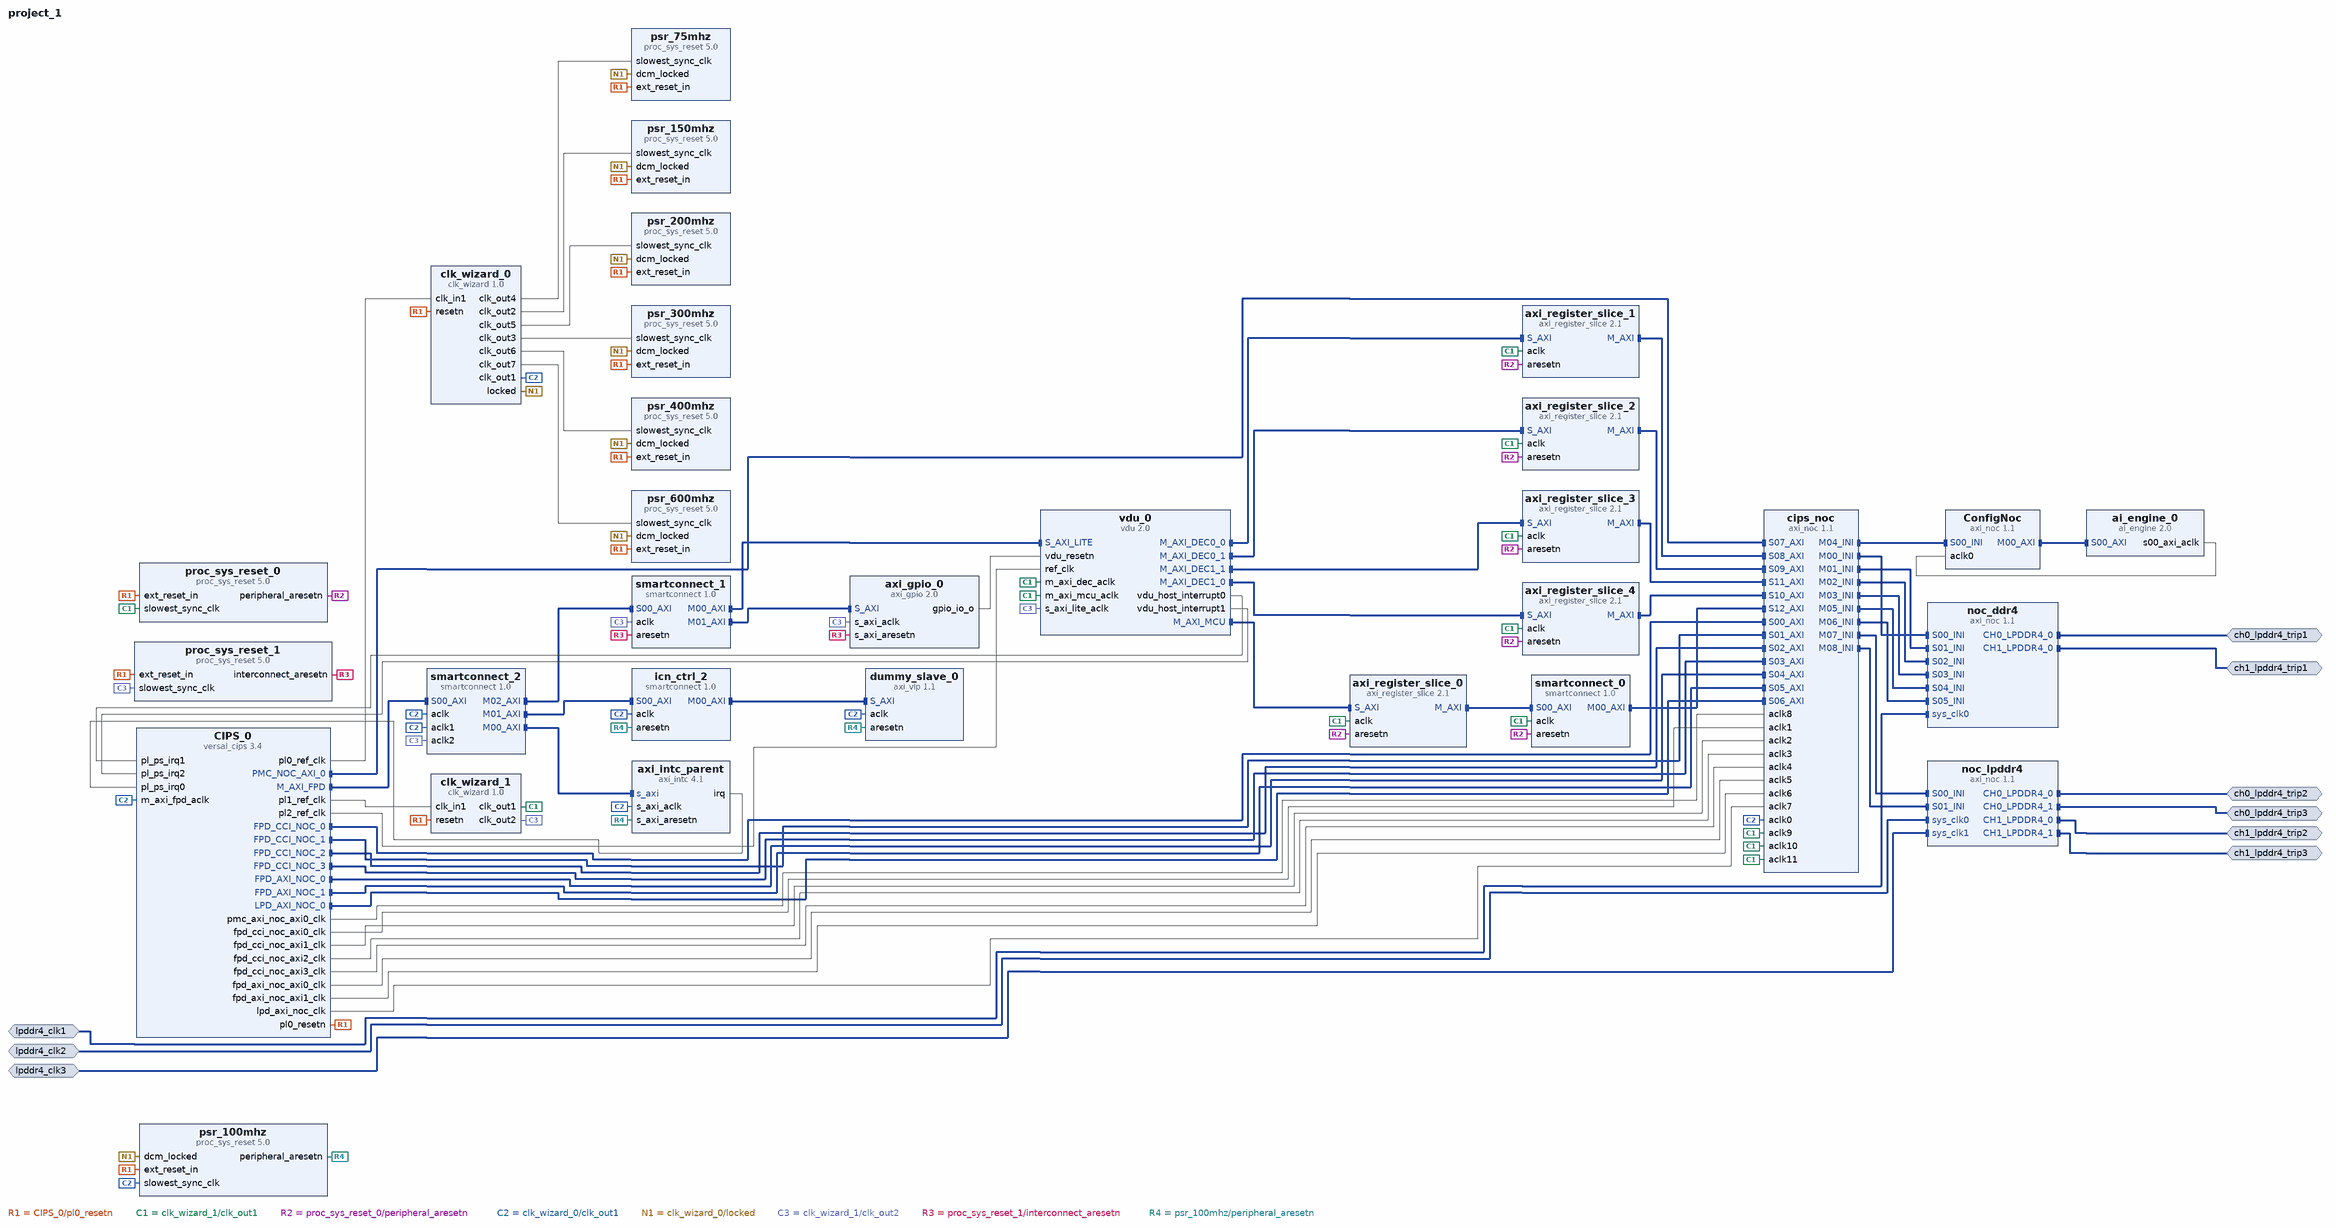
[diagram p0: block diagram of the top level]
# Vivado block design project_1, xcve2802-vsvh1760-2MP-e-S, Vivado 2025.2
create_bd_design project_1

create_bd_intf_port -mode Master -vlnv xilinx.com:interface:lpddr4_rtl:1.0 ch0_lpddr4_trip1
create_bd_intf_port -mode Master -vlnv xilinx.com:interface:lpddr4_rtl:1.0 ch0_lpddr4_trip2
create_bd_intf_port -mode Master -vlnv xilinx.com:interface:lpddr4_rtl:1.0 ch0_lpddr4_trip3
create_bd_intf_port -mode Master -vlnv xilinx.com:interface:lpddr4_rtl:1.0 ch1_lpddr4_trip1
create_bd_intf_port -mode Master -vlnv xilinx.com:interface:lpddr4_rtl:1.0 ch1_lpddr4_trip2
create_bd_intf_port -mode Master -vlnv xilinx.com:interface:lpddr4_rtl:1.0 ch1_lpddr4_trip3
create_bd_intf_port -mode Slave -vlnv xilinx.com:interface:diff_clock_rtl:1.0 lpddr4_clk1
set_property -dict {CONFIG.FREQ_HZ 200200200} [get_bd_intf_ports lpddr4_clk1]
create_bd_intf_port -mode Slave -vlnv xilinx.com:interface:diff_clock_rtl:1.0 lpddr4_clk2
set_property -dict {CONFIG.FREQ_HZ 200200200} [get_bd_intf_ports lpddr4_clk2]
create_bd_intf_port -mode Slave -vlnv xilinx.com:interface:diff_clock_rtl:1.0 lpddr4_clk3
set_property -dict {CONFIG.FREQ_HZ 200200200} [get_bd_intf_ports lpddr4_clk3]

create_bd_cell -type ip -vlnv xilinx.com:ip:versal_cips:3.4 CIPS_0
set_property -dict [list \
  CONFIG.DDR_MEMORY_MODE Custom \
  CONFIG.DEBUG_MODE JTAG \
  CONFIG.DESIGN_MODE 1 \
  CONFIG.DEVICE_INTEGRITY_MODE {Sysmon temperature voltage and external IO monitoring} \
  CONFIG.PS_BOARD_INTERFACE ps_pmc_fixed_io \
  CONFIG.PS_PL_CONNECTIVITY_MODE Custom \
  CONFIG.PS_PMC_CONFIG {['DDR_MEMORY_MODE {Connectivity to DDR via NOC}', 'DEBUG_MODE JTAG', 'DESIGN_MODE 1', 'DEVICE_INTEGRITY_MODE {Sysmon temperature voltage and external IO monitoring}', 'PMC_CRP_PL1_REF_CTRL_FREQMHZ 100', 'PMC_CRP_PL2_REF_CTRL_FREQMHZ 100', 'PMC_GPIO0_MIO_PERIPHERAL {{ENABLE 1} {IO {PMC_MIO 0 .. 25}}}', 'PMC_GPIO1_MIO_PERIPHERAL {{ENABLE 1} {IO {PMC_MIO 26 .. 51}}}', 'PMC_MIO12 {{AUX_IO 0} {DIRECTION out} {DRIVE_STRENGTH 8mA} {OUTPUT_DATA default} {PULL pullup} {SCHMITT 0} {SLEW slow} {USAGE GPIO}}', 'PMC_MIO37 {{AUX_IO 0} {DIRECTION out} {DRIVE_STRENGTH 8mA} {OUTPUT_DATA high} {PULL pullup} {SCHMITT 0} {SLEW slow} {USAGE GPIO}}', 'PMC_MIO38 {{AUX_IO 0} {DIRECTION out} {DRIVE_STRENGTH 8mA} {OUTPUT_DATA high} {PULL pullup} {SCHMITT 0} {SLEW slow} {USAGE GPIO}}', 'PMC_OSPI_PERIPHERAL {{ENABLE 1} {IO {PMC_MIO 0 .. 11}} {MODE Single}}', 'PMC_REF_CLK_FREQMHZ 33.3333', 'PMC_SD1 {{CD_ENABLE 1} {CD_IO {PMC_MIO 28}} {POW_ENABLE 1} {POW_IO {PMC_MIO 51}} {RESET_ENABLE 0} {RESET_IO {PMC_MIO 12}} {WP_ENABLE 0} {WP_IO {PMC_MIO 1}}}', 'PMC_SD1_PERIPHERAL {{CLK_100_SDR_OTAP_DLY 0x3} {CLK_200_SDR_OTAP_DLY 0x2} {CLK_50_DDR_ITAP_DLY 0x36} {CLK_50_DDR_OTAP_DLY 0x3} {CLK_50_SDR_ITAP_DLY 0x2C} {CLK_50_SDR_OTAP_DLY 0x4} {ENABLE 1} {IO {PMC_MIO 26 .. 36}}}', 'PMC_SD1_SLOT_TYPE {SD 3.0}', 'PMC_USE_PMC_NOC_AXI0 1', 'PS_BOARD_INTERFACE ps_pmc_fixed_io', 'PS_CAN0_PERIPHERAL {{ENABLE 1} {IO {PS_MIO 14 .. 15}}}', 'PS_CAN1_PERIPHERAL {{ENABLE 1} {IO {PS_MIO 16 .. 17}}}', 'PS_CRL_CAN0_REF_CTRL_FREQMHZ 160', 'PS_CRL_CAN1_REF_CTRL_FREQMHZ 160', 'PS_ENET0_MDIO {{ENABLE 1} {IO {PS_MIO 24 .. 25}}}', 'PS_ENET0_PERIPHERAL {{ENABLE 1} {IO {PS_MIO 0 .. 11}}}', 'PS_GEN_IPI0_ENABLE 1', 'PS_GEN_IPI0_MASTER A72', 'PS_GEN_IPI1_ENABLE 1', 'PS_GEN_IPI1_MASTER R5_0', 'PS_GEN_IPI2_ENABLE 1', 'PS_GEN_IPI2_MASTER R5_1', 'PS_GEN_IPI3_ENABLE 1', 'PS_GEN_IPI4_ENABLE 1', 'PS_GEN_IPI5_ENABLE 1', 'PS_GEN_IPI6_ENABLE 1', 'PS_GPIO_EMIO_PERIPHERAL_ENABLE 1', 'PS_GPIO_EMIO_WIDTH 1', 'PS_HSDP_EGRESS_TRAFFIC JTAG', 'PS_HSDP_INGRESS_TRAFFIC JTAG', 'PS_HSDP_MODE NONE', 'PS_I2C0_PERIPHERAL {{ENABLE 1} {IO {PMC_MIO 46 .. 47}}}', 'PS_I2C1_PERIPHERAL {{ENABLE 1} {IO {PMC_MIO 44 .. 45}}}', 'PS_I2CSYSMON_PERIPHERAL {{ENABLE 0} {IO {PMC_MIO 39 .. 40}}}', 'PS_IRQ_USAGE {{CH0 1} {CH1 1} {CH10 0} {CH11 0} {CH12 0} {CH13 0} {CH14 0} {CH15 0} {CH2 1} {CH3 0} {CH4 0} {CH5 0} {CH6 0} {CH7 0} {CH8 0} {CH9 0}}', 'PS_LPDMA0_ROUTE_THROUGH_FPD 1', 'PS_LPDMA1_ROUTE_THROUGH_FPD 1', 'PS_LPDMA2_ROUTE_THROUGH_FPD 1', 'PS_LPDMA3_ROUTE_THROUGH_FPD 1', 'PS_LPDMA4_ROUTE_THROUGH_FPD 1', 'PS_LPDMA5_ROUTE_THROUGH_FPD 1', 'PS_LPDMA6_ROUTE_THROUGH_FPD 1', 'PS_LPDMA7_ROUTE_THROUGH_FPD 1', 'PS_MIO7 {{AUX_IO 0} {DIRECTION in} {DRIVE_STRENGTH 8mA} {OUTPUT_DATA default} {PULL disable} {SCHMITT 0} {SLEW slow} {USAGE Reserved}}', 'PS_MIO9 {{AUX_IO 0} {DIRECTION in} {DRIVE_STRENGTH 8mA} {OUTPUT_DATA default} {PULL disable} {SCHMITT 0} {SLEW slow} {USAGE Reserved}}', 'PS_NUM_FABRIC_RESETS 1', 'PS_PCIE_EP_RESET1_IO {PS_MIO 18}', 'PS_PCIE_EP_RESET2_IO {PS_MIO 19}', 'PS_PCIE_RESET {ENABLE 1}', 'PS_PL_CONNECTIVITY_MODE Custom', 'PS_TTC0_PERIPHERAL_ENABLE 1', 'PS_TTC1_PERIPHERAL_ENABLE 1', 'PS_TTC2_PERIPHERAL_ENABLE 1', 'PS_TTC3_PERIPHERAL_ENABLE 1', 'PS_UART0_PERIPHERAL {{ENABLE 1} {IO {PMC_MIO 42 .. 43}}}', 'PS_USB3_PERIPHERAL {{ENABLE 1} {IO {PMC_MIO 13 .. 25}}}', 'PS_USE_FPD_AXI_NOC0 1', 'PS_USE_FPD_AXI_NOC1 1', 'PS_USE_FPD_CCI_NOC 1', 'PS_USE_M_AXI_FPD 1', 'PS_USE_M_AXI_LPD 0', 'PS_USE_NOC_LPD_AXI0 1', 'PS_USE_PMCPL_CLK0 1', 'PS_USE_PMCPL_CLK1 1', 'PS_USE_PMCPL_CLK2 1', 'PS_USE_PMCPL_CLK3 0', 'SMON_ALARMS Set_Alarms_On', 'SMON_ENABLE_TEMP_AVERAGING 0', 'SMON_INTERFACE_TO_USE I2C', 'SMON_MEAS24 {{ALARM_ENABLE 1} {ALARM_LOWER 0.00} {ALARM_UPPER 2.00} {AVERAGE_EN 0} {ENABLE 1} {MODE {2 V unipolar}} {NAME VCCAUX} {SUPPLY_NUM 0}}', 'SMON_MEAS25 {{ALARM_ENABLE 1} {ALARM_LOWER 0.00} {ALARM_UPPER 2.00} {AVERAGE_EN 0} {ENABLE 1} {MODE {2 V unipolar}} {NAME VCCAUX_PMC} {SUPPLY_NUM 1}}', 'SMON_MEAS44 {{ALARM_ENABLE 1} {ALARM_LOWER 0.00} {ALARM_UPPER 2.00} {AVERAGE_EN 0} {ENABLE 1} {MODE {2 V unipolar}} {NAME VCC_PMC} {SUPPLY_NUM 2}}', 'SMON_MEAS45 {{ALARM_ENABLE 1} {ALARM_LOWER 0.00} {ALARM_UPPER 2.00} {AVERAGE_EN 0} {ENABLE 1} {MODE {2 V unipolar}} {NAME VCC_PSFP} {SUPPLY_NUM 3}}', 'SMON_MEAS46 {{ALARM_ENABLE 1} {ALARM_LOWER 0.00} {ALARM_UPPER 2.00} {AVERAGE_EN 0} {ENABLE 1} {MODE {2 V unipolar}} {NAME VCC_PSLP} {SUPPLY_NUM 4}}', 'SMON_MEAS48 {{ALARM_ENABLE 1} {ALARM_LOWER 0.00} {ALARM_UPPER 2.00} {AVERAGE_EN 0} {ENABLE 1} {MODE {2 V unipolar}} {NAME VCC_SOC} {SUPPLY_NUM 5}}', 'SMON_MEAS49 {{ALARM_ENABLE 1} {ALARM_LOWER 0.00} {ALARM_UPPER 1.00} {AVERAGE_EN 0} {ENABLE 1} {MODE {1 V unipolar}} {NAME VP_VN} {SUPPLY_NUM 6}}', 'SMON_PMBUS_ADDRESS 0x18', 'SMON_TEMP_AVERAGING_SAMPLES 0']} \
  CONFIG.PS_PMC_CONFIG_APPLIED 1 \
] [get_bd_cells CIPS_0]
create_bd_cell -type ip -vlnv xilinx.com:ip:axi_noc:1.1 ConfigNoc
set_property -dict {CONFIG.NUM_CLKS 1 CONFIG.NUM_MI 1 CONFIG.NUM_NSI 1 CONFIG.NUM_SI 0} [get_bd_cells ConfigNoc]
create_bd_cell -type ip -vlnv xilinx.com:ip:ai_engine:2.0 ai_engine_0
set_property -dict [list \
  CONFIG.NUM_CLKS 0 \
  CONFIG.NUM_MI_AXI 0 \
  CONFIG.NUM_MI_AXIS 0 \
  CONFIG.NUM_SI_AXI 1 \
  CONFIG.NUM_SI_AXIS 0 \
] [get_bd_cells ai_engine_0]
create_bd_cell -type ip -vlnv xilinx.com:ip:axi_intc:4.1 axi_intc_parent
set_property -dict {CONFIG.C_ASYNC_INTR 0xFFFFFFFF CONFIG.C_IRQ_CONNECTION 1} [get_bd_cells axi_intc_parent]
create_bd_cell -type ip -vlnv xilinx.com:ip:axi_register_slice:2.1 axi_register_slice_0
create_bd_cell -type ip -vlnv xilinx.com:ip:axi_register_slice:2.1 axi_register_slice_1
create_bd_cell -type ip -vlnv xilinx.com:ip:axi_register_slice:2.1 axi_register_slice_2
create_bd_cell -type ip -vlnv xilinx.com:ip:axi_register_slice:2.1 axi_register_slice_3
create_bd_cell -type ip -vlnv xilinx.com:ip:axi_register_slice:2.1 axi_register_slice_4
create_bd_cell -type ip -vlnv xilinx.com:ip:axi_noc:1.1 cips_noc
set_property -dict [list \
  CONFIG.NUM_CLKS 12 \
  CONFIG.NUM_MC 0 \
  CONFIG.NUM_MI 0 \
  CONFIG.NUM_NMI 9 \
  CONFIG.NUM_NSI 0 \
  CONFIG.NUM_SI 13 \
] [get_bd_cells cips_noc]
create_bd_cell -type ip -vlnv xilinx.com:ip:clk_wizard:1.0 clk_wizard_0
set_property -dict [list \
  CONFIG.CLKOUT_DRIVES BUFG,BUFG,BUFG,BUFG,BUFG,BUFG,BUFG \
  CONFIG.CLKOUT_DYN_PS None,None,None,None,None,None,None \
  CONFIG.CLKOUT_MATCHED_ROUTING false,false,false,false,false,false,false \
  CONFIG.CLKOUT_PORT clk_out1,clk_out2,clk_out3,clk_out4,clk_out5,clk_out6,clk_out7 \
  CONFIG.CLKOUT_REQUESTED_DUTY_CYCLE 50.000,50.000,50.000,50.000,50.000,50.000,50.000 \
  CONFIG.CLKOUT_REQUESTED_OUT_FREQUENCY 100,150,300,75,200,400,600 \
  CONFIG.CLKOUT_REQUESTED_PHASE 0.000,0.000,0.000,0.000,0.000,0.000,0.000 \
  CONFIG.CLKOUT_USED true,true,true,true,true,true,true \
  CONFIG.JITTER_SEL Min_O_Jitter \
  CONFIG.RESET_TYPE ACTIVE_LOW \
  CONFIG.USE_LOCKED true \
  CONFIG.USE_PHASE_ALIGNMENT true \
  CONFIG.USE_RESET true \
] [get_bd_cells clk_wizard_0]
create_bd_cell -type ip -vlnv xilinx.com:ip:clk_wizard:1.0 clk_wizard_1
set_property -dict [list \
  CONFIG.CLKOUT_DRIVES BUFG,BUFG,BUFG,BUFG,BUFG,BUFG,BUFG \
  CONFIG.CLKOUT_DYN_PS None,None,None,None,None,None,None \
  CONFIG.CLKOUT_GROUPING Auto,Auto,Auto,Auto,Auto,Auto,Auto \
  CONFIG.CLKOUT_MATCHED_ROUTING false,false,false,false,false,false,false \
  CONFIG.CLKOUT_PORT clk_out1,clk_out2,clk_out3,clk_out4,clk_out5,clk_out6,clk_out7 \
  CONFIG.CLKOUT_REQUESTED_DUTY_CYCLE 50.000,50.000,50.000,50.000,50.000,50.000,50.000 \
  CONFIG.CLKOUT_REQUESTED_OUT_FREQUENCY 100.000,100.000,100.000,100.000,100.000,100.000,100.000 \
  CONFIG.CLKOUT_REQUESTED_PHASE 0.000,0.000,0.000,0.000,0.000,0.000,0.000 \
  CONFIG.CLKOUT_USED true,true,false,false,false,false,false \
  CONFIG.RESET_TYPE ACTIVE_LOW \
  CONFIG.USE_RESET true \
] [get_bd_cells clk_wizard_1]
create_bd_cell -type ip -vlnv xilinx.com:ip:axi_vip:1.1 dummy_slave_0
set_property -dict {CONFIG.INTERFACE_MODE SLAVE} [get_bd_cells dummy_slave_0]
create_bd_cell -type ip -vlnv xilinx.com:ip:smartconnect:1.0 icn_ctrl_2
set_property -dict {CONFIG.NUM_CLKS 1 CONFIG.NUM_MI 1 CONFIG.NUM_SI 1} [get_bd_cells icn_ctrl_2]
create_bd_cell -type ip -vlnv xilinx.com:ip:axi_noc:1.1 noc_ddr4
set_property -dict [list \
  CONFIG.CH0_LPDDR4_0_BOARD_INTERFACE ch0_lpddr4_trip1 \
  CONFIG.CH1_LPDDR4_0_BOARD_INTERFACE ch1_lpddr4_trip1 \
  CONFIG.MC_CHAN_REGION0 DDR_LOW0 \
  CONFIG.MC_CHAN_REGION1 DDR_LOW1 \
  CONFIG.NUM_CLKS 0 \
  CONFIG.NUM_MC 1 \
  CONFIG.NUM_MCP 4 \
  CONFIG.NUM_MI 0 \
  CONFIG.NUM_NSI 6 \
  CONFIG.NUM_SI 0 \
  CONFIG.sys_clk0_BOARD_INTERFACE lpddr4_clk1 \
] [get_bd_cells noc_ddr4]
create_bd_cell -type ip -vlnv xilinx.com:ip:axi_noc:1.1 noc_lpddr4
set_property -dict [list \
  CONFIG.CH0_LPDDR4_0_BOARD_INTERFACE ch0_lpddr4_trip2 \
  CONFIG.CH0_LPDDR4_1_BOARD_INTERFACE ch0_lpddr4_trip3 \
  CONFIG.CH1_LPDDR4_0_BOARD_INTERFACE ch1_lpddr4_trip2 \
  CONFIG.CH1_LPDDR4_1_BOARD_INTERFACE ch1_lpddr4_trip3 \
  CONFIG.MC_CHAN_REGION0 DDR_CH1 \
  CONFIG.NUM_CLKS 0 \
  CONFIG.NUM_MCP 4 \
  CONFIG.NUM_MI 0 \
  CONFIG.NUM_NSI 2 \
  CONFIG.NUM_SI 0 \
  CONFIG.sys_clk0_BOARD_INTERFACE lpddr4_clk2 \
  CONFIG.sys_clk1_BOARD_INTERFACE lpddr4_clk3 \
] [get_bd_cells noc_lpddr4]
create_bd_cell -type ip -vlnv xilinx.com:ip:proc_sys_reset:5.0 proc_sys_reset_0
create_bd_cell -type ip -vlnv xilinx.com:ip:proc_sys_reset:5.0 proc_sys_reset_1
create_bd_cell -type ip -vlnv xilinx.com:ip:proc_sys_reset:5.0 psr_100mhz
create_bd_cell -type ip -vlnv xilinx.com:ip:proc_sys_reset:5.0 psr_150mhz
create_bd_cell -type ip -vlnv xilinx.com:ip:proc_sys_reset:5.0 psr_200mhz
create_bd_cell -type ip -vlnv xilinx.com:ip:proc_sys_reset:5.0 psr_300mhz
create_bd_cell -type ip -vlnv xilinx.com:ip:proc_sys_reset:5.0 psr_400mhz
create_bd_cell -type ip -vlnv xilinx.com:ip:proc_sys_reset:5.0 psr_600mhz
create_bd_cell -type ip -vlnv xilinx.com:ip:proc_sys_reset:5.0 psr_75mhz
create_bd_cell -type ip -vlnv xilinx.com:ip:smartconnect:1.0 smartconnect_0
set_property -dict {CONFIG.NUM_SI 1} [get_bd_cells smartconnect_0]
create_bd_cell -type ip -vlnv xilinx.com:ip:smartconnect:1.0 smartconnect_1
set_property -dict {CONFIG.NUM_MI 2 CONFIG.NUM_SI 1} [get_bd_cells smartconnect_1]
create_bd_cell -type ip -vlnv xilinx.com:ip:vdu:2.0 vdu_0
set_property -dict {CONFIG.CORE_CLK 800 CONFIG.MCU_CLK 571 CONFIG.NO_OF_DEC_INSTANCES 1} [get_bd_cells vdu_0]
create_bd_cell -type ip -vlnv xilinx.com:ip:smartconnect:1.0 smartconnect_2
set_property -dict {CONFIG.NUM_CLKS 3 CONFIG.NUM_MI 3 CONFIG.NUM_SI 1} [get_bd_cells smartconnect_2]
create_bd_cell -type ip -vlnv xilinx.com:ip:axi_gpio:2.0 axi_gpio_0
set_property -dict {CONFIG.C_ALL_OUTPUTS 1 CONFIG.C_GPIO_WIDTH 1} [get_bd_cells axi_gpio_0]

# ---- connections ----

connect_bd_intf_net -intf_net CIPS_0_IF_PMC_NOC_AXI_0 [get_bd_intf_pins CIPS_0/PMC_NOC_AXI_0] [get_bd_intf_pins cips_noc/S07_AXI]
connect_bd_intf_net -intf_net CIPS_0_IF_PS_NOC_CCI_0 [get_bd_intf_pins CIPS_0/FPD_CCI_NOC_0] [get_bd_intf_pins cips_noc/S00_AXI]
connect_bd_intf_net -intf_net CIPS_0_IF_PS_NOC_CCI_1 [get_bd_intf_pins CIPS_0/FPD_CCI_NOC_1] [get_bd_intf_pins cips_noc/S01_AXI]
connect_bd_intf_net -intf_net CIPS_0_IF_PS_NOC_CCI_2 [get_bd_intf_pins CIPS_0/FPD_CCI_NOC_2] [get_bd_intf_pins cips_noc/S02_AXI]
connect_bd_intf_net -intf_net CIPS_0_IF_PS_NOC_CCI_3 [get_bd_intf_pins CIPS_0/FPD_CCI_NOC_3] [get_bd_intf_pins cips_noc/S03_AXI]
connect_bd_intf_net -intf_net CIPS_0_IF_PS_NOC_NCI_0 [get_bd_intf_pins CIPS_0/FPD_AXI_NOC_0] [get_bd_intf_pins cips_noc/S04_AXI]
connect_bd_intf_net -intf_net CIPS_0_IF_PS_NOC_NCI_1 [get_bd_intf_pins CIPS_0/FPD_AXI_NOC_1] [get_bd_intf_pins cips_noc/S05_AXI]
connect_bd_intf_net -intf_net CIPS_0_IF_PS_NOC_RPU_0 [get_bd_intf_pins CIPS_0/LPD_AXI_NOC_0] [get_bd_intf_pins cips_noc/S06_AXI]
connect_bd_intf_net [get_bd_intf_pins CIPS_0/M_AXI_FPD] [get_bd_intf_pins smartconnect_2/S00_AXI]
connect_bd_intf_net [get_bd_intf_pins ConfigNoc/M00_AXI] [get_bd_intf_pins ai_engine_0/S00_AXI]
connect_bd_intf_net -intf_net axi_noc_0_CH0_LPDDR4_0 [get_bd_intf_ports ch0_lpddr4_trip1] [get_bd_intf_pins noc_ddr4/CH0_LPDDR4_0]
connect_bd_intf_net -intf_net axi_noc_0_CH1_LPDDR4_0 [get_bd_intf_ports ch1_lpddr4_trip1] [get_bd_intf_pins noc_ddr4/CH1_LPDDR4_0]
connect_bd_intf_net [get_bd_intf_pins axi_register_slice_0/M_AXI] [get_bd_intf_pins smartconnect_0/S00_AXI]
connect_bd_intf_net [get_bd_intf_pins axi_register_slice_1/M_AXI] [get_bd_intf_pins cips_noc/S08_AXI]
connect_bd_intf_net [get_bd_intf_pins axi_register_slice_2/M_AXI] [get_bd_intf_pins cips_noc/S09_AXI]
connect_bd_intf_net [get_bd_intf_pins axi_register_slice_3/M_AXI] [get_bd_intf_pins cips_noc/S11_AXI]
connect_bd_intf_net [get_bd_intf_pins axi_register_slice_4/M_AXI] [get_bd_intf_pins cips_noc/S10_AXI]
connect_bd_intf_net [get_bd_intf_pins cips_noc/M00_INI] [get_bd_intf_pins noc_ddr4/S00_INI]
connect_bd_intf_net [get_bd_intf_pins cips_noc/M01_INI] [get_bd_intf_pins noc_ddr4/S01_INI]
connect_bd_intf_net [get_bd_intf_pins cips_noc/M02_INI] [get_bd_intf_pins noc_ddr4/S02_INI]
connect_bd_intf_net [get_bd_intf_pins cips_noc/M03_INI] [get_bd_intf_pins noc_ddr4/S03_INI]
connect_bd_intf_net [get_bd_intf_pins ConfigNoc/S00_INI] [get_bd_intf_pins cips_noc/M04_INI]
connect_bd_intf_net [get_bd_intf_pins cips_noc/M05_INI] [get_bd_intf_pins noc_ddr4/S04_INI]
connect_bd_intf_net [get_bd_intf_pins cips_noc/M06_INI] [get_bd_intf_pins noc_ddr4/S05_INI]
connect_bd_intf_net [get_bd_intf_pins cips_noc/M07_INI] [get_bd_intf_pins noc_lpddr4/S00_INI]
connect_bd_intf_net [get_bd_intf_pins cips_noc/M08_INI] [get_bd_intf_pins noc_lpddr4/S01_INI]
connect_bd_intf_net [get_bd_intf_pins dummy_slave_0/S_AXI] [get_bd_intf_pins icn_ctrl_2/M00_AXI]
connect_bd_intf_net -intf_net lpddr4_clk1_1 [get_bd_intf_ports lpddr4_clk1] [get_bd_intf_pins noc_ddr4/sys_clk0]
connect_bd_intf_net -intf_net lpddr4_clk2_1 [get_bd_intf_ports lpddr4_clk2] [get_bd_intf_pins noc_lpddr4/sys_clk0]
connect_bd_intf_net -intf_net lpddr4_clk3_1 [get_bd_intf_ports lpddr4_clk3] [get_bd_intf_pins noc_lpddr4/sys_clk1]
connect_bd_intf_net [get_bd_intf_ports ch0_lpddr4_trip2] [get_bd_intf_pins noc_lpddr4/CH0_LPDDR4_0]
connect_bd_intf_net [get_bd_intf_ports ch0_lpddr4_trip3] [get_bd_intf_pins noc_lpddr4/CH0_LPDDR4_1]
connect_bd_intf_net [get_bd_intf_ports ch1_lpddr4_trip2] [get_bd_intf_pins noc_lpddr4/CH1_LPDDR4_0]
connect_bd_intf_net [get_bd_intf_ports ch1_lpddr4_trip3] [get_bd_intf_pins noc_lpddr4/CH1_LPDDR4_1]
connect_bd_intf_net [get_bd_intf_pins cips_noc/S12_AXI] [get_bd_intf_pins smartconnect_0/M00_AXI]
connect_bd_intf_net [get_bd_intf_pins smartconnect_1/M00_AXI] [get_bd_intf_pins vdu_0/S_AXI_LITE]
connect_bd_intf_net [get_bd_intf_pins smartconnect_1/M01_AXI] [get_bd_intf_pins axi_gpio_0/S_AXI]
connect_bd_intf_net [get_bd_intf_pins smartconnect_2/M00_AXI] [get_bd_intf_pins axi_intc_parent/s_axi]
connect_bd_intf_net [get_bd_intf_pins smartconnect_2/M01_AXI] [get_bd_intf_pins icn_ctrl_2/S00_AXI]
connect_bd_intf_net [get_bd_intf_pins smartconnect_2/M02_AXI] [get_bd_intf_pins smartconnect_1/S00_AXI]
connect_bd_intf_net [get_bd_intf_pins axi_register_slice_1/S_AXI] [get_bd_intf_pins vdu_0/M_AXI_DEC0_0]
connect_bd_intf_net [get_bd_intf_pins axi_register_slice_2/S_AXI] [get_bd_intf_pins vdu_0/M_AXI_DEC0_1]
connect_bd_intf_net [get_bd_intf_pins axi_register_slice_4/S_AXI] [get_bd_intf_pins vdu_0/M_AXI_DEC1_0]
connect_bd_intf_net [get_bd_intf_pins axi_register_slice_3/S_AXI] [get_bd_intf_pins vdu_0/M_AXI_DEC1_1]
connect_bd_intf_net [get_bd_intf_pins axi_register_slice_0/S_AXI] [get_bd_intf_pins vdu_0/M_AXI_MCU]
connect_bd_net [get_bd_pins CIPS_0/pl0_ref_clk] [get_bd_pins clk_wizard_0/clk_in1]
connect_bd_net [get_bd_pins CIPS_0/pl1_ref_clk] [get_bd_pins clk_wizard_1/clk_in1]
connect_bd_net [get_bd_pins CIPS_0/pl2_ref_clk] [get_bd_pins vdu_0/ref_clk]
connect_bd_net -net CIPS_0_pl_resetn1 [get_bd_pins CIPS_0/pl0_resetn] \
  [get_bd_pins clk_wizard_0/resetn] [get_bd_pins clk_wizard_1/resetn] [get_bd_pins proc_sys_reset_0/ext_reset_in] \
  [get_bd_pins proc_sys_reset_1/ext_reset_in] [get_bd_pins psr_100mhz/ext_reset_in] [get_bd_pins psr_150mhz/ext_reset_in] \
  [get_bd_pins psr_200mhz/ext_reset_in] [get_bd_pins psr_300mhz/ext_reset_in] [get_bd_pins psr_400mhz/ext_reset_in] \
  [get_bd_pins psr_600mhz/ext_reset_in] [get_bd_pins psr_75mhz/ext_reset_in]
connect_bd_net -net CIPS_0_ps_pmc_noc_axi0_clk [get_bd_pins CIPS_0/pmc_axi_noc_axi0_clk] [get_bd_pins cips_noc/aclk8]
connect_bd_net -net CIPS_0_ps_ps_noc_cci_axi0_clk [get_bd_pins CIPS_0/fpd_cci_noc_axi0_clk] [get_bd_pins cips_noc/aclk1]
connect_bd_net -net CIPS_0_ps_ps_noc_cci_axi1_clk [get_bd_pins CIPS_0/fpd_cci_noc_axi1_clk] [get_bd_pins cips_noc/aclk2]
connect_bd_net -net CIPS_0_ps_ps_noc_cci_axi2_clk [get_bd_pins CIPS_0/fpd_cci_noc_axi2_clk] [get_bd_pins cips_noc/aclk3]
connect_bd_net -net CIPS_0_ps_ps_noc_cci_axi3_clk [get_bd_pins CIPS_0/fpd_cci_noc_axi3_clk] [get_bd_pins cips_noc/aclk4]
connect_bd_net -net CIPS_0_ps_ps_noc_nci_axi0_clk [get_bd_pins CIPS_0/fpd_axi_noc_axi0_clk] [get_bd_pins cips_noc/aclk5]
connect_bd_net -net CIPS_0_ps_ps_noc_nci_axi1_clk [get_bd_pins CIPS_0/fpd_axi_noc_axi1_clk] [get_bd_pins cips_noc/aclk6]
connect_bd_net -net CIPS_0_ps_ps_noc_rpu_axi0_clk [get_bd_pins CIPS_0/lpd_axi_noc_clk] [get_bd_pins cips_noc/aclk7]
connect_bd_net [get_bd_pins clk_wizard_1/clk_out1] \
  [get_bd_pins axi_register_slice_0/aclk] [get_bd_pins axi_register_slice_1/aclk] [get_bd_pins axi_register_slice_2/aclk] \
  [get_bd_pins axi_register_slice_3/aclk] [get_bd_pins axi_register_slice_4/aclk] [get_bd_pins cips_noc/aclk9] \
  [get_bd_pins cips_noc/aclk10] [get_bd_pins cips_noc/aclk11] [get_bd_pins proc_sys_reset_0/slowest_sync_clk] \
  [get_bd_pins smartconnect_0/aclk] [get_bd_pins vdu_0/m_axi_dec_aclk] [get_bd_pins vdu_0/m_axi_mcu_aclk]
connect_bd_net [get_bd_pins proc_sys_reset_0/peripheral_aresetn] \
  [get_bd_pins axi_register_slice_0/aresetn] [get_bd_pins axi_register_slice_1/aresetn] \
  [get_bd_pins axi_register_slice_2/aresetn] [get_bd_pins axi_register_slice_3/aresetn] \
  [get_bd_pins axi_register_slice_4/aresetn] [get_bd_pins smartconnect_0/aresetn]
connect_bd_net [get_bd_pins ai_engine_0/s00_axi_aclk] [get_bd_pins ConfigNoc/aclk0]
connect_bd_net [get_bd_pins axi_gpio_0/gpio_io_o] [get_bd_pins vdu_0/vdu_resetn]
connect_bd_net -net axi_intc_3_irq [get_bd_pins axi_intc_parent/irq] [get_bd_pins CIPS_0/pl_ps_irq0]
connect_bd_net [get_bd_pins clk_wizard_0/clk_out1] \
  [get_bd_pins axi_intc_parent/s_axi_aclk] [get_bd_pins cips_noc/aclk0] [get_bd_pins dummy_slave_0/aclk] \
  [get_bd_pins icn_ctrl_2/aclk] [get_bd_pins psr_100mhz/slowest_sync_clk] [get_bd_pins smartconnect_2/aclk] \
  [get_bd_pins smartconnect_2/aclk1] [get_bd_pins CIPS_0/m_axi_fpd_aclk]
connect_bd_net [get_bd_pins clk_wizard_0/clk_out2] [get_bd_pins psr_150mhz/slowest_sync_clk]
connect_bd_net [get_bd_pins clk_wizard_0/clk_out3] [get_bd_pins psr_300mhz/slowest_sync_clk]
connect_bd_net [get_bd_pins clk_wizard_0/clk_out4] [get_bd_pins psr_75mhz/slowest_sync_clk]
connect_bd_net [get_bd_pins clk_wizard_0/clk_out5] [get_bd_pins psr_200mhz/slowest_sync_clk]
connect_bd_net [get_bd_pins clk_wizard_0/clk_out6] [get_bd_pins psr_400mhz/slowest_sync_clk]
connect_bd_net [get_bd_pins clk_wizard_0/clk_out7] [get_bd_pins psr_600mhz/slowest_sync_clk]
connect_bd_net [get_bd_pins clk_wizard_0/locked] \
  [get_bd_pins psr_100mhz/dcm_locked] [get_bd_pins psr_150mhz/dcm_locked] [get_bd_pins psr_200mhz/dcm_locked] \
  [get_bd_pins psr_300mhz/dcm_locked] [get_bd_pins psr_400mhz/dcm_locked] [get_bd_pins psr_600mhz/dcm_locked] \
  [get_bd_pins psr_75mhz/dcm_locked]
connect_bd_net [get_bd_pins clk_wizard_1/clk_out2] \
  [get_bd_pins proc_sys_reset_1/slowest_sync_clk] [get_bd_pins smartconnect_1/aclk] [get_bd_pins vdu_0/s_axi_lite_aclk] \
  [get_bd_pins smartconnect_2/aclk2] [get_bd_pins axi_gpio_0/s_axi_aclk]
connect_bd_net [get_bd_pins proc_sys_reset_1/interconnect_aresetn] [get_bd_pins smartconnect_1/aresetn] [get_bd_pins axi_gpio_0/s_axi_aresetn]
connect_bd_net [get_bd_pins psr_100mhz/peripheral_aresetn] \
  [get_bd_pins axi_intc_parent/s_axi_aresetn] [get_bd_pins icn_ctrl_2/aresetn] [get_bd_pins dummy_slave_0/aresetn]
connect_bd_net [get_bd_pins vdu_0/vdu_host_interrupt0] [get_bd_pins CIPS_0/pl_ps_irq1]
connect_bd_net [get_bd_pins vdu_0/vdu_host_interrupt1] [get_bd_pins CIPS_0/pl_ps_irq2]
set_property PFM.AXI_PORT {S00_AXI {memport "S_AXI_NOC" sptag "S_AXI_AIE" auto "false" memory "ai_engine_0 AIE_ARRAY_0"} S01_AXI {memport "S_AXI_NOC" sptag "S_AXI_AIE" auto "false" memory "ai_engine_0 AIE_ARRAY_0"} S02_AXI {memport "S_AXI_NOC" sptag "S_AXI_AIE" auto "false" memory "ai_engine_0 AIE_ARRAY_0"} S03_AXI {memport "S_AXI_NOC" sptag "S_AXI_AIE" auto "false" memory "ai_engine_0 AIE_ARRAY_0"} S04_AXI {memport "S_AXI_NOC" sptag "S_AXI_AIE" auto "false" memory "ai_engine_0 AIE_ARRAY_0"} S05_AXI {memport "S_AXI_NOC" sptag "S_AXI_AIE" auto "false" memory "ai_engine_0 AIE_ARRAY_0"}} [get_bd_cells ConfigNoc]
set_property PFM.IRQ {intr {id 0 range 32}} [get_bd_cells axi_intc_parent]
set_property PFM.CLOCK {clk_out1 {id "1" is_default "false" proc_sys_reset "psr_100mhz" status "fixed"} clk_out2 {id "0" is_default "false" proc_sys_reset "psr_150mhz" status "fixed"} clk_out3 {id "2" is_default "true" proc_sys_reset "psr_300mhz" status "fixed"} clk_out4 {id "3" is_default "false" proc_sys_reset "psr_75mhz" status "fixed"} clk_out5 {id "4" is_default "false" proc_sys_reset "psr_200mhz" status "fixed"} clk_out6 {id "5" is_default "false" proc_sys_reset "psr_400mhz" status "fixed"} clk_out7 {id "6" is_default "false" proc_sys_reset "psr_600mhz" status "fixed"}} [get_bd_cells clk_wizard_0]
set_property PFM.AXI_PORT {M01_AXI {memport "M_AXI_GP" sptag "" memory ""} M02_AXI {memport "M_AXI_GP" sptag "" memory ""} M03_AXI {memport "M_AXI_GP" sptag "" memory ""} M04_AXI {memport "M_AXI_GP" sptag "" memory ""} M05_AXI {memport "M_AXI_GP" sptag "" memory ""} M06_AXI {memport "M_AXI_GP" sptag "" memory ""} M07_AXI {memport "M_AXI_GP" sptag "" memory ""} M08_AXI {memport "M_AXI_GP" sptag "" memory ""} M09_AXI {memport "M_AXI_GP" sptag "" memory ""} M10_AXI {memport "M_AXI_GP" sptag "" memory ""} M11_AXI {memport "M_AXI_GP" sptag "" memory ""} M12_AXI {memport "M_AXI_GP" sptag "" memory ""} M13_AXI {memport "M_AXI_GP" sptag "" memory ""} M14_AXI {memport "M_AXI_GP" sptag "" memory ""} M15_AXI {memport "M_AXI_GP" sptag "" memory ""}} [get_bd_cells icn_ctrl_2]
set_property PFM.AXI_PORT {S00_AXI {memport "S_AXI_NOC" sptag "DDR"} S01_AXI {memport "S_AXI_NOC" sptag "DDR"} S02_AXI {memport "S_AXI_NOC" sptag "DDR"} S03_AXI {memport "S_AXI_NOC" sptag "DDR"} S04_AXI {memport "S_AXI_NOC" sptag "DDR"} S05_AXI {memport "S_AXI_NOC" sptag "DDR"} S06_AXI {memport "S_AXI_NOC" sptag "DDR"} S07_AXI {memport "S_AXI_NOC" sptag "DDR"} S08_AXI {memport "S_AXI_NOC" sptag "DDR"} S09_AXI {memport "S_AXI_NOC" sptag "DDR"} S10_AXI {memport "S_AXI_NOC" sptag "DDR"} S11_AXI {memport "S_AXI_NOC" sptag "DDR"} S12_AXI {memport "S_AXI_NOC" sptag "DDR"} S13_AXI {memport "S_AXI_NOC" sptag "DDR"} S14_AXI {memport "S_AXI_NOC" sptag "DDR"} S15_AXI {memport "S_AXI_NOC" sptag "DDR"} S16_AXI {memport "S_AXI_NOC" sptag "DDR"} S17_AXI {memport "S_AXI_NOC" sptag "DDR"} S18_AXI {memport "S_AXI_NOC" sptag "DDR"} S19_AXI {memport "S_AXI_NOC" sptag "DDR"} S20_AXI {memport "S_AXI_NOC" sptag "DDR"} S21_AXI {memport "S_AXI_NOC" sptag "DDR"} S22_AXI {memport "S_AXI_NOC" sptag "DDR"} S23_AXI {memport "S_AXI_NOC" sptag "DDR"} S24_AXI {memport "S_AXI_NOC" sptag "DDR"} S25_AXI {memport "S_AXI_NOC" sptag "DDR"} S26_AXI {memport "S_AXI_NOC" sptag "DDR"} S27_AXI {memport "S_AXI_NOC" sptag "DDR"}} [get_bd_cells noc_ddr4]
set_property PFM.AXI_PORT {S00_AXI {memport "S_AXI_NOC" sptag "LPDDR"} S01_AXI {memport "S_AXI_NOC" sptag "LPDDR"} S02_AXI {memport "S_AXI_NOC" sptag "LPDDR"} S03_AXI {memport "S_AXI_NOC" sptag "LPDDR"} S04_AXI {memport "S_AXI_NOC" sptag "LPDDR"} S05_AXI {memport "S_AXI_NOC" sptag "LPDDR"} S06_AXI {memport "S_AXI_NOC" sptag "LPDDR"} S07_AXI {memport "S_AXI_NOC" sptag "LPDDR"} S08_AXI {memport "S_AXI_NOC" sptag "LPDDR"} S09_AXI {memport "S_AXI_NOC" sptag "LPDDR"} S10_AXI {memport "S_AXI_NOC" sptag "LPDDR"} S11_AXI {memport "S_AXI_NOC" sptag "LPDDR"} S12_AXI {memport "S_AXI_NOC" sptag "LPDDR"} S13_AXI {memport "S_AXI_NOC" sptag "LPDDR"} S14_AXI {memport "S_AXI_NOC" sptag "LPDDR"} S15_AXI {memport "S_AXI_NOC" sptag "LPDDR"} S16_AXI {memport "S_AXI_NOC" sptag "LPDDR"} S17_AXI {memport "S_AXI_NOC" sptag "LPDDR"} S18_AXI {memport "S_AXI_NOC" sptag "LPDDR"} S19_AXI {memport "S_AXI_NOC" sptag "LPDDR"} S20_AXI {memport "S_AXI_NOC" sptag "LPDDR"} S21_AXI {memport "S_AXI_NOC" sptag "LPDDR"} S22_AXI {memport "S_AXI_NOC" sptag "LPDDR"} S23_AXI {memport "S_AXI_NOC" sptag "LPDDR"} S24_AXI {memport "S_AXI_NOC" sptag "LPDDR"} S25_AXI {memport "S_AXI_NOC" sptag "LPDDR"} S26_AXI {memport "S_AXI_NOC" sptag "LPDDR"} S27_AXI {memport "S_AXI_NOC" sptag "LPDDR"}} [get_bd_cells noc_lpddr4]
set_property PFM.AXI_PORT {M03_AXI {memport "M_AXI_GP" sptag "" memory "" is_range "true"} M04_AXI {memport "M_AXI_GP" sptag "" memory "" is_range "true"}} [get_bd_cells smartconnect_2]

# ---- address map ----
assign_bd_address -offset 0x0000000000000000 -range 2G -target_address_space [get_bd_addr_spaces CIPS_0/FPD_AXI_NOC_0] [get_bd_addr_segs noc_ddr4/S00_INI/C0_DDR_LOW0]
assign_bd_address -offset 0x0000000880000000 -range 2G -target_address_space [get_bd_addr_spaces CIPS_0/FPD_AXI_NOC_0] [get_bd_addr_segs noc_ddr4/S00_INI/C0_DDR_LOW1]
assign_bd_address -offset 0x0000000000000000 -range 2G -target_address_space [get_bd_addr_spaces CIPS_0/FPD_AXI_NOC_1] [get_bd_addr_segs noc_ddr4/S00_INI/C0_DDR_LOW0]
assign_bd_address -offset 0x0000000880000000 -range 2G -target_address_space [get_bd_addr_spaces CIPS_0/FPD_AXI_NOC_1] [get_bd_addr_segs noc_ddr4/S00_INI/C0_DDR_LOW1]
assign_bd_address -offset 0x0000000000000000 -range 2G -target_address_space [get_bd_addr_spaces CIPS_0/FPD_CCI_NOC_0] [get_bd_addr_segs noc_ddr4/S00_INI/C0_DDR_LOW0]
assign_bd_address -offset 0x0000000880000000 -range 2G -target_address_space [get_bd_addr_spaces CIPS_0/FPD_CCI_NOC_0] [get_bd_addr_segs noc_ddr4/S00_INI/C0_DDR_LOW1]
assign_bd_address -offset 0x0000020000000000 -range 4G -target_address_space [get_bd_addr_spaces CIPS_0/FPD_CCI_NOC_0] [get_bd_addr_segs ai_engine_0/S00_AXI/AIE_ARRAY_0]
assign_bd_address -offset 0x0000000000000000 -range 2G -target_address_space [get_bd_addr_spaces CIPS_0/FPD_CCI_NOC_1] [get_bd_addr_segs noc_ddr4/S01_INI/C0_DDR_LOW0]
assign_bd_address -offset 0x0000000880000000 -range 2G -target_address_space [get_bd_addr_spaces CIPS_0/FPD_CCI_NOC_1] [get_bd_addr_segs noc_ddr4/S01_INI/C0_DDR_LOW1]
assign_bd_address -offset 0x0000020000000000 -range 4G -target_address_space [get_bd_addr_spaces CIPS_0/FPD_CCI_NOC_1] [get_bd_addr_segs ai_engine_0/S00_AXI/AIE_ARRAY_0]
assign_bd_address -offset 0x0000000000000000 -range 2G -target_address_space [get_bd_addr_spaces CIPS_0/FPD_CCI_NOC_2] [get_bd_addr_segs noc_ddr4/S02_INI/C1_DDR_LOW0]
assign_bd_address -offset 0x0000000880000000 -range 2G -target_address_space [get_bd_addr_spaces CIPS_0/FPD_CCI_NOC_2] [get_bd_addr_segs noc_ddr4/S02_INI/C1_DDR_LOW1]
assign_bd_address -offset 0x0000020000000000 -range 4G -target_address_space [get_bd_addr_spaces CIPS_0/FPD_CCI_NOC_2] [get_bd_addr_segs ai_engine_0/S00_AXI/AIE_ARRAY_0]
assign_bd_address -offset 0x0000050000000000 -range 8G -target_address_space [get_bd_addr_spaces CIPS_0/FPD_CCI_NOC_2] [get_bd_addr_segs noc_lpddr4/S00_INI/C0_DDR_CH1x2]
assign_bd_address -offset 0x0000000000000000 -range 2G -target_address_space [get_bd_addr_spaces CIPS_0/FPD_CCI_NOC_3] [get_bd_addr_segs noc_ddr4/S03_INI/C2_DDR_LOW0]
assign_bd_address -offset 0x0000000880000000 -range 2G -target_address_space [get_bd_addr_spaces CIPS_0/FPD_CCI_NOC_3] [get_bd_addr_segs noc_ddr4/S03_INI/C2_DDR_LOW1]
assign_bd_address -offset 0x0000020000000000 -range 4G -target_address_space [get_bd_addr_spaces CIPS_0/FPD_CCI_NOC_3] [get_bd_addr_segs ai_engine_0/S00_AXI/AIE_ARRAY_0]
assign_bd_address -offset 0x0000050000000000 -range 8G -target_address_space [get_bd_addr_spaces CIPS_0/FPD_CCI_NOC_3] [get_bd_addr_segs noc_lpddr4/S01_INI/C1_DDR_CH1x2]
assign_bd_address -offset 0x0000000000000000 -range 2G -target_address_space [get_bd_addr_spaces CIPS_0/LPD_AXI_NOC_0] [get_bd_addr_segs noc_ddr4/S00_INI/C0_DDR_LOW0]
assign_bd_address -offset 0x0000000880000000 -range 2G -target_address_space [get_bd_addr_spaces CIPS_0/LPD_AXI_NOC_0] [get_bd_addr_segs noc_ddr4/S00_INI/C0_DDR_LOW1]
assign_bd_address -offset 0x000A4000000 -range 8M -target_address_space [get_bd_addr_spaces CIPS_0/M_AXI_FPD] [get_bd_addr_segs vdu_0/S_AXI_LITE/Reg]
assign_bd_address -offset 0x000A4800000 -range 64K -target_address_space [get_bd_addr_spaces CIPS_0/M_AXI_FPD] [get_bd_addr_segs dummy_slave_0/S_AXI/Reg]
assign_bd_address -offset 0x000A4810000 -range 64K -target_address_space [get_bd_addr_spaces CIPS_0/M_AXI_FPD] [get_bd_addr_segs axi_gpio_0/S_AXI/Reg]
assign_bd_address -offset 0x000A4820000 -range 64K -target_address_space [get_bd_addr_spaces CIPS_0/M_AXI_FPD] [get_bd_addr_segs axi_intc_parent/S_AXI/Reg]
assign_bd_address -offset 0x0000000000000000 -range 2G -target_address_space [get_bd_addr_spaces CIPS_0/PMC_NOC_AXI_0] [get_bd_addr_segs noc_ddr4/S00_INI/C0_DDR_LOW0]
assign_bd_address -offset 0x0000000880000000 -range 2G -target_address_space [get_bd_addr_spaces CIPS_0/PMC_NOC_AXI_0] [get_bd_addr_segs noc_ddr4/S00_INI/C0_DDR_LOW1]
assign_bd_address -offset 0x0000020000000000 -range 4G -target_address_space [get_bd_addr_spaces CIPS_0/PMC_NOC_AXI_0] [get_bd_addr_segs ai_engine_0/S00_AXI/AIE_ARRAY_0]
assign_bd_address -offset 0x0000000000000000 -range 2G -target_address_space [get_bd_addr_spaces vdu_0/Code0] [get_bd_addr_segs noc_ddr4/S05_INI/C3_DDR_LOW0]
assign_bd_address -offset 0x0000000880000000 -range 2G -target_address_space [get_bd_addr_spaces vdu_0/Code0] [get_bd_addr_segs noc_ddr4/S05_INI/C3_DDR_LOW1]
assign_bd_address -offset 0x0000000000000000 -range 2G -target_address_space [get_bd_addr_spaces vdu_0/DecData0_0] [get_bd_addr_segs noc_ddr4/S01_INI/C0_DDR_LOW0]
assign_bd_address -offset 0x0000000880000000 -range 2G -target_address_space [get_bd_addr_spaces vdu_0/DecData0_0] [get_bd_addr_segs noc_ddr4/S01_INI/C0_DDR_LOW1]
assign_bd_address -offset 0x0000000000000000 -range 2G -target_address_space [get_bd_addr_spaces vdu_0/DecData0_1] [get_bd_addr_segs noc_ddr4/S02_INI/C1_DDR_LOW0]
assign_bd_address -offset 0x0000000880000000 -range 2G -target_address_space [get_bd_addr_spaces vdu_0/DecData0_1] [get_bd_addr_segs noc_ddr4/S02_INI/C1_DDR_LOW1]
assign_bd_address -offset 0x0000000000000000 -range 2G -target_address_space [get_bd_addr_spaces vdu_0/DecData1_0] [get_bd_addr_segs noc_ddr4/S03_INI/C2_DDR_LOW0]
assign_bd_address -offset 0x0000000880000000 -range 2G -target_address_space [get_bd_addr_spaces vdu_0/DecData1_0] [get_bd_addr_segs noc_ddr4/S03_INI/C2_DDR_LOW1]
assign_bd_address -offset 0x0000000000000000 -range 2G -target_address_space [get_bd_addr_spaces vdu_0/DecData1_1] [get_bd_addr_segs noc_ddr4/S04_INI/C3_DDR_LOW0]
assign_bd_address -offset 0x0000000880000000 -range 2G -target_address_space [get_bd_addr_spaces vdu_0/DecData1_1] [get_bd_addr_segs noc_ddr4/S04_INI/C3_DDR_LOW1]

validate_bd_design
save_bd_design
